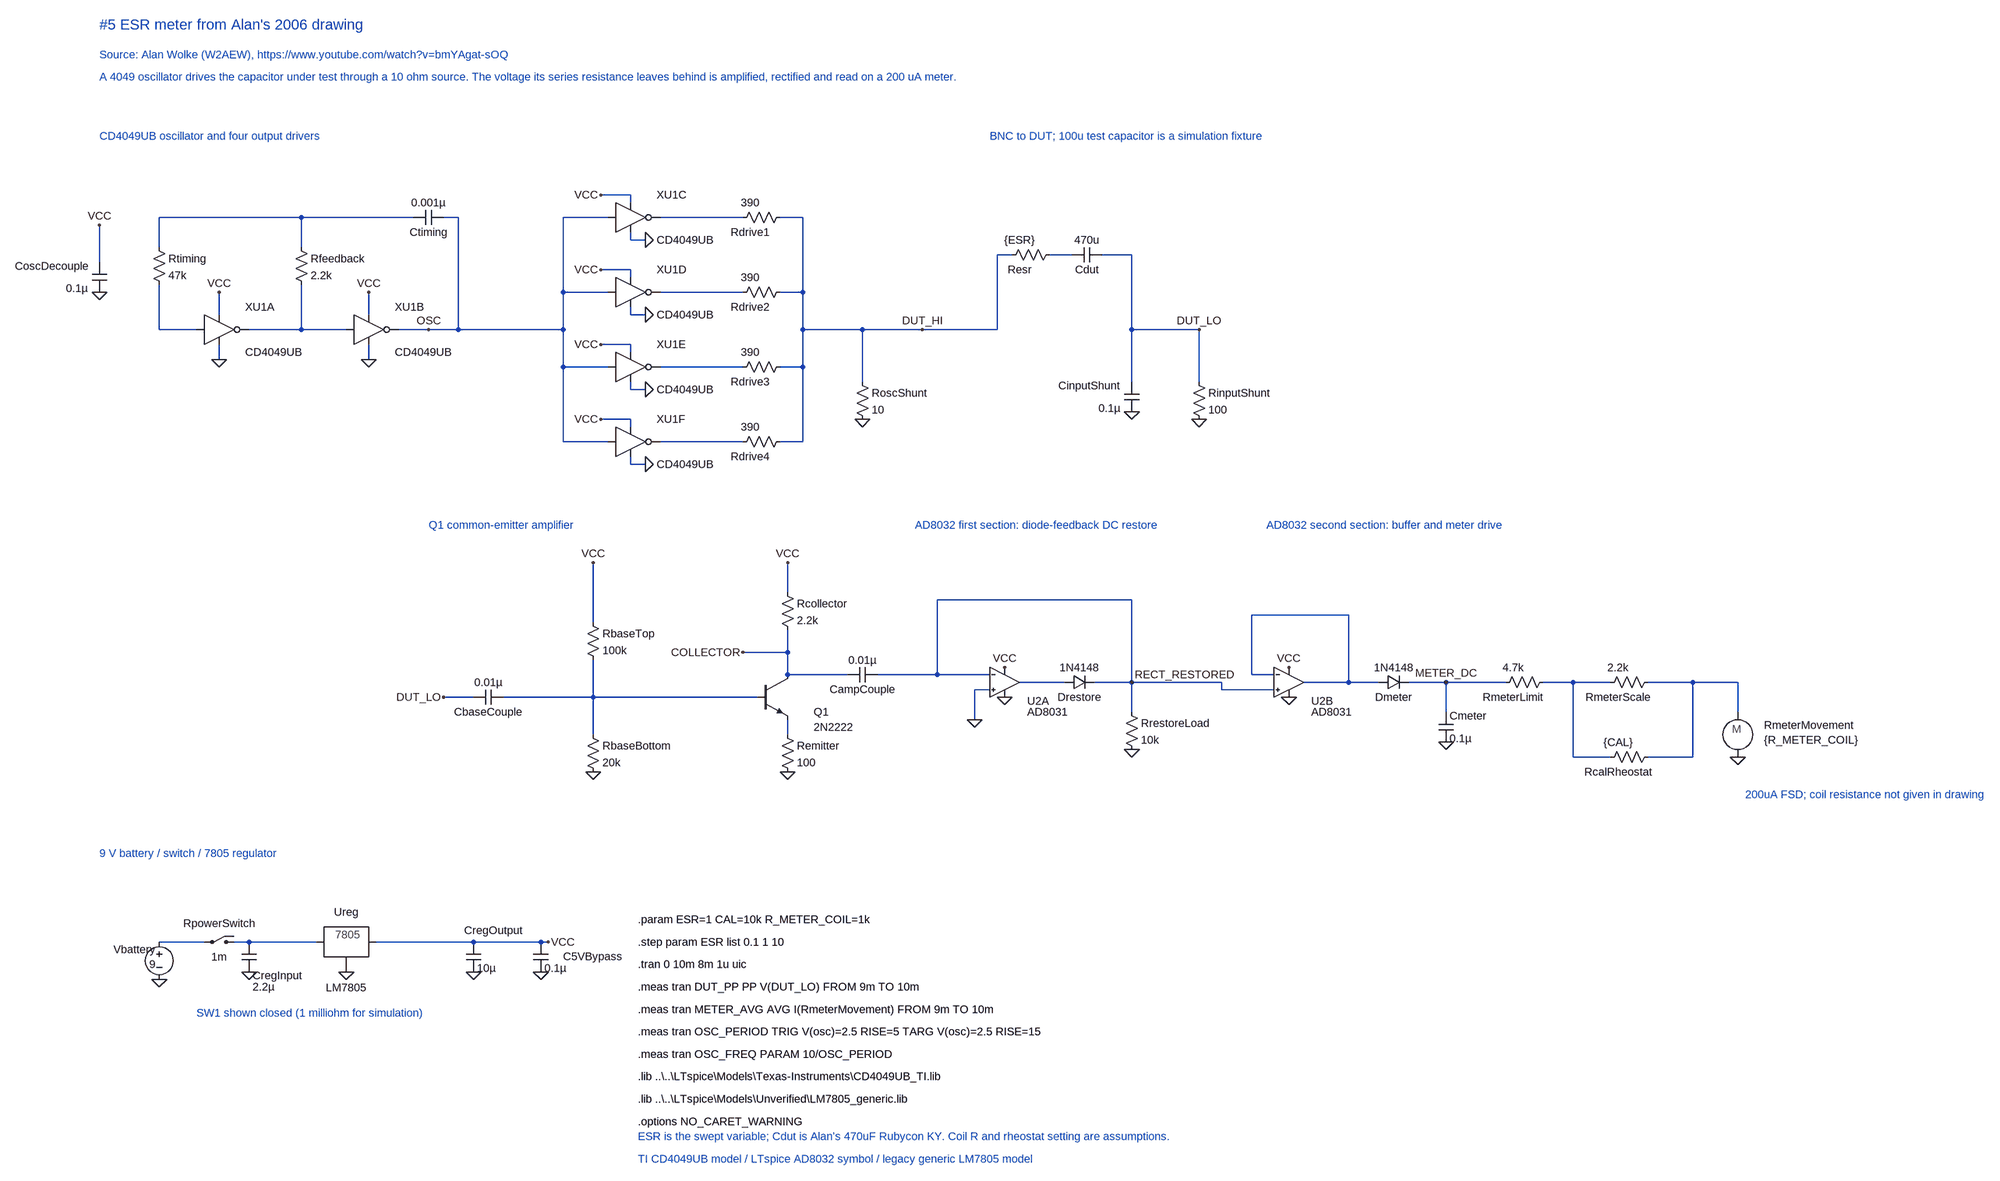
[diagram p0: schematic Alan drawing ESR meter.asc]
Alan drawing ESR meter.asc, the LTspice schematic file:
Version 4.1
SHEET 1 5200 2600
WIRE 336 -672 336 -688
WIRE 336 -688 272 -688
WIRE -368 -640 -672 -640
WIRE -128 -640 -368 -640
WIRE -32 -640 -64 -640
WIRE 288 -640 192 -640
WIRE 576 -640 400 -640
WIRE 704 -640 656 -640
WIRE -672 -576 -672 -640
WIRE -368 -576 -368 -640
WIRE 336 -608 336 -592
WIRE 336 -592 368 -592
WIRE 1152 -560 1120 -560
WIRE 1280 -560 1232 -560
WIRE 1408 -560 1344 -560
WIRE -800 -544 -800 -624
WIRE 336 -512 336 -528
WIRE 336 -528 272 -528
WIRE 192 -480 192 -640
WIRE 288 -480 192 -480
WIRE 576 -480 400 -480
WIRE 704 -480 704 -640
WIRE 704 -480 656 -480
WIRE -544 -432 -544 -480
WIRE -224 -432 -224 -480
WIRE 336 -448 336 -432
WIRE 336 -432 368 -432
WIRE -672 -400 -672 -496
WIRE -592 -400 -672 -400
WIRE -368 -400 -368 -496
WIRE -368 -400 -480 -400
WIRE -272 -400 -368 -400
WIRE -32 -400 -32 -640
WIRE -32 -400 -160 -400
WIRE 192 -400 192 -480
WIRE 192 -400 -32 -400
WIRE 704 -400 704 -480
WIRE 832 -400 704 -400
WIRE 960 -400 832 -400
WIRE 1120 -400 1120 -560
WIRE 1120 -400 960 -400
WIRE 1408 -400 1408 -560
WIRE 1552 -400 1408 -400
WIRE 336 -352 336 -368
WIRE 336 -368 272 -368
WIRE -544 -336 -544 -368
WIRE -224 -336 -224 -368
WIRE 192 -320 192 -400
WIRE 288 -320 192 -320
WIRE 576 -320 400 -320
WIRE 704 -320 704 -400
WIRE 704 -320 656 -320
WIRE 832 -288 832 -400
WIRE 1408 -288 1408 -400
WIRE 1552 -288 1552 -400
WIRE 336 -288 336 -272
WIRE 336 -272 368 -272
WIRE 336 -192 336 -208
WIRE 336 -208 272 -208
WIRE 192 -160 192 -320
WIRE 288 -160 192 -160
WIRE 576 -160 400 -160
WIRE 704 -160 704 -320
WIRE 704 -160 656 -160
WIRE 336 -128 336 -112
WIRE 336 -112 368 -112
WIRE 672 176 672 112
WIRE 1408 192 992 192
WIRE 1872 224 1664 224
WIRE 256 240 256 112
WIRE 672 304 672 256
WIRE 672 304 576 304
WIRE 672 352 672 304
WIRE 800 352 672 352
WIRE 992 352 992 192
WIRE 992 352 864 352
WIRE 1104 352 992 352
WIRE 1664 352 1664 224
WIRE 1712 352 1664 352
WIRE 1264 368 1168 368
WIRE 1408 368 1408 192
WIRE 1408 368 1328 368
WIRE 1600 368 1408 368
WIRE 1872 368 1872 224
WIRE 1872 368 1776 368
WIRE 1936 368 1872 368
WIRE 2080 368 2000 368
WIRE 2208 368 2080 368
WIRE 2352 368 2288 368
WIRE 2432 368 2352 368
WIRE 2608 368 2512 368
WIRE 2704 368 2608 368
WIRE 1104 384 1072 384
WIRE 1600 384 1600 368
WIRE 1712 384 1600 384
WIRE 0 400 -64 400
WIRE 256 400 256 320
WIRE 256 400 64 400
WIRE 608 400 256 400
WIRE 1408 432 1408 368
WIRE 2080 432 2080 368
WIRE 2704 432 2704 368
WIRE 1072 448 1072 384
WIRE 256 480 256 400
WIRE 672 480 672 448
WIRE 2352 528 2352 368
WIRE 2432 528 2352 528
WIRE 2608 528 2608 368
WIRE 2608 528 2512 528
WIRE -576 944 -672 944
WIRE -480 944 -512 944
WIRE -336 944 -480 944
WIRE 0 944 -208 944
WIRE 144 944 0 944
WIRE 160 944 144 944
FLAG -96 -400 OSC
FLAG -544 -480 VCC
FLAG -544 -336 0
FLAG -224 -480 VCC
FLAG -224 -336 0
FLAG -800 -624 VCC
FLAG -800 -480 0
FLAG 272 -688 VCC
FLAG 368 -592 0
FLAG 272 -528 VCC
FLAG 368 -432 0
FLAG 272 -368 VCC
FLAG 368 -272 0
FLAG 272 -208 VCC
FLAG 368 -112 0
FLAG 832 -208 0
FLAG 960 -400 DUT_HI
FLAG 1552 -400 DUT_LO
FLAG 1408 -224 0
FLAG 1552 -208 0
FLAG -64 400 DUT_LO
FLAG 256 112 VCC
FLAG 256 560 0
FLAG 672 112 VCC
FLAG 576 304 COLLECTOR
FLAG 672 560 0
FLAG 1136 336 VCC
FLAG 1136 400 0
FLAG 1072 448 0
FLAG 1408 512 0
FLAG 1408 368 RECT_RESTORED
FLAG 1744 336 VCC
FLAG 1744 400 0
FLAG 2080 496 0
FLAG 2080 368 METER_DC
FLAG 2704 528 0
FLAG -672 1024 0
FLAG -272 1008 0
FLAG -480 1008 0
FLAG 0 1008 0
FLAG 144 1008 0
FLAG 160 944 VCC
SYMBOL ..\..\LTspice\Symbols\CD4049UB_gate -560 -400 R0
SYMATTR InstName XU1A
SYMBOL ..\..\LTspice\Symbols\CD4049UB_gate -240 -400 R0
SYMATTR InstName XU1B
SYMBOL res -688 -592 R0
SYMATTR InstName Rtiming
SYMATTR Value 47k
SYMBOL res -384 -592 R0
SYMATTR InstName Rfeedback
SYMATTR Value 2.2k
SYMBOL cap -128 -624 R270
WINDOW 0 0 32 VBottom 2
WINDOW 3 32 32 VTop 2
SYMATTR InstName Ctiming
SYMATTR Value 0.001µ
SYMBOL cap -816 -544 R0
WINDOW 0 -8 8 Right 2
WINDOW 3 -8 56 Right 2
SYMATTR InstName CoscDecouple
SYMATTR Value 0.1µ
SYMBOL ..\..\LTspice\Symbols\CD4049UB_gate 320 -640 R0
SYMATTR InstName XU1C
SYMBOL res 560 -624 R270
WINDOW 0 0 32 VBottom 2
WINDOW 3 32 32 VTop 2
SYMATTR InstName Rdrive1
SYMATTR Value 390
SYMBOL ..\..\LTspice\Symbols\CD4049UB_gate 320 -480 R0
SYMATTR InstName XU1D
SYMBOL res 560 -464 R270
WINDOW 0 0 32 VBottom 2
WINDOW 3 32 32 VTop 2
SYMATTR InstName Rdrive2
SYMATTR Value 390
SYMBOL ..\..\LTspice\Symbols\CD4049UB_gate 320 -320 R0
SYMATTR InstName XU1E
SYMBOL res 560 -304 R270
WINDOW 0 0 32 VBottom 2
WINDOW 3 32 32 VTop 2
SYMATTR InstName Rdrive3
SYMATTR Value 390
SYMBOL ..\..\LTspice\Symbols\CD4049UB_gate 320 -160 R0
SYMATTR InstName XU1F
SYMBOL res 560 -144 R270
WINDOW 0 0 32 VBottom 2
WINDOW 3 32 32 VTop 2
SYMATTR InstName Rdrive4
SYMATTR Value 390
SYMBOL res 816 -304 R0
SYMATTR InstName RoscShunt
SYMATTR Value 10
SYMBOL res 1136 -544 R270
WINDOW 0 0 32 VBottom 2
WINDOW 3 32 32 VTop 2
SYMATTR InstName Resr
SYMATTR Value {ESR}
SYMBOL cap 1280 -544 R270
WINDOW 0 0 32 VBottom 2
WINDOW 3 32 32 VTop 2
SYMATTR InstName Cdut
SYMATTR Value 470u
SYMBOL cap 1392 -288 R0
WINDOW 0 -8 8 Right 2
WINDOW 3 -8 56 Right 2
SYMATTR InstName CinputShunt
SYMATTR Value 0.1µ
SYMBOL res 1536 -304 R0
SYMATTR InstName RinputShunt
SYMATTR Value 100
SYMBOL cap 0 416 R270
WINDOW 0 0 32 VBottom 2
WINDOW 3 32 32 VTop 2
SYMATTR InstName CbaseCouple
SYMATTR Value 0.01µ
SYMBOL res 240 224 R0
SYMATTR InstName RbaseTop
SYMATTR Value 100k
SYMBOL res 240 464 R0
SYMATTR InstName RbaseBottom
SYMATTR Value 20k
SYMBOL npn 608 352 R0
WINDOW 0 120 80 Left 2
WINDOW 3 120 112 Left 2
SYMATTR InstName Q1
SYMATTR Value 2N2222
SYMBOL res 656 160 R0
SYMATTR InstName Rcollector
SYMATTR Value 2.2k
SYMBOL res 656 464 R0
SYMATTR InstName Remitter
SYMATTR Value 100
SYMBOL cap 800 368 R270
WINDOW 0 0 32 VBottom 2
WINDOW 3 32 32 VTop 2
SYMATTR InstName CampCouple
SYMATTR Value 0.01µ
SYMBOL ..\..\LTspice\Symbols\AD8032-section 1136 368 R0
SYMATTR InstName U2A
SYMBOL diode 1264 384 R270
WINDOW 0 0 32 VBottom 2
WINDOW 3 32 32 VTop 2
SYMATTR InstName Drestore
SYMATTR Value 1N4148
SYMBOL res 1392 416 R0
SYMATTR InstName RrestoreLoad
SYMATTR Value 10k
SYMBOL ..\..\LTspice\Symbols\AD8032-section 1744 368 R0
SYMATTR InstName U2B
SYMBOL diode 1936 384 R270
WINDOW 0 0 32 VBottom 2
WINDOW 3 32 32 VTop 2
SYMATTR InstName Dmeter
SYMATTR Value 1N4148
SYMBOL cap 2064 432 R0
SYMATTR InstName Cmeter
SYMATTR Value 0.1µ
SYMBOL res 2192 384 R270
WINDOW 0 0 32 VBottom 2
WINDOW 3 32 32 VTop 2
SYMATTR InstName RmeterLimit
SYMATTR Value 4.7k
SYMBOL res 2416 384 R270
WINDOW 0 0 32 VBottom 2
WINDOW 3 32 32 VTop 2
SYMATTR InstName RmeterScale
SYMATTR Value 2.2k
SYMBOL res 2416 544 R270
WINDOW 0 0 32 VBottom 2
WINDOW 3 32 32 VTop 2
SYMATTR InstName RcalRheostat
SYMATTR Value {CAL}
SYMBOL ..\..\LTspice\Symbols\meter_movement 2704 464 R0
SYMATTR InstName RmeterMovement
SYMBOL voltage -672 928 R0
WINDOW 0 -8 32 Right 2
WINDOW 3 -8 64 Right 2
SYMATTR InstName Vbattery
SYMATTR Value 9
SYMBOL ..\..\LTspice\Symbols\power_switch_closed -544 944 R0
WINDOW 0 0 -40 Center 2
SYMATTR InstName RpowerSwitch
SYMBOL ..\..\LTspice\Symbols\LM7805 -272 944 R0
WINDOW 3 0 98 Center 2
SYMATTR InstName Ureg
SYMBOL cap -496 944 R0
WINDOW 0 24 72 Left 2
WINDOW 3 24 96 Left 2
SYMATTR InstName CregInput
SYMATTR Value 2.2µ
SYMBOL cap -16 944 R0
WINDOW 0 -4 -25 Left 2
SYMATTR InstName CregOutput
SYMATTR Value 10µ
SYMBOL cap 128 944 R0
WINDOW 0 64 31 Left 2
SYMATTR InstName C5VBypass
SYMATTR Value 0.1µ
TEXT -800 -1056 Left 3 ;#5 ESR meter from Alan's 2006 drawing
TEXT -800 -992 Left 2 ;Source: Alan Wolke (W2AEW), https://www.youtube.com/watch?v=bmYAgat-sOQ
TEXT -800 -944 Left 2 ;A 4049 oscillator drives the capacitor under test through a 10 ohm source. The voltage its series resistance leaves behind is amplified, rectified and read on a 200 uA meter.
TEXT -800 -816 Left 2 ;CD4049UB oscillator and four output drivers
TEXT 1104 -816 Left 2 ;BNC to DUT; 100u test capacitor is a simulation fixture
TEXT -96 32 Left 2 ;Q1 common-emitter amplifier
TEXT 944 32 Left 2 ;AD8032 first section: diode-feedback DC restore
TEXT 1696 32 Left 2 ;AD8032 second section: buffer and meter drive
TEXT 2720 608 Left 2 ;200uA FSD; coil resistance not given in drawing
TEXT -800 736 Left 2 ;9 V battery / switch / 7805 regulator
TEXT -592 1096 Left 2 ;SW1 shown closed (1 milliohm for simulation)
TEXT 352 896 Left 2 !.param ESR=1 CAL=10k R_METER_COIL=1k
TEXT 352 944 Left 2 !.step param ESR list 0.1 1 10
TEXT 352 992 Left 2 !.tran 0 10m 8m 1u uic
TEXT 352 1040 Left 2 !.meas tran DUT_PP PP V(DUT_LO) FROM 9m TO 10m
TEXT 352 1136 Left 2 !.meas tran OSC_PERIOD TRIG V(osc)=2.5 RISE=5 TARG V(osc)=2.5 RISE=15
TEXT 352 1184 Left 2 !.meas tran OSC_FREQ PARAM 10/OSC_PERIOD
TEXT 352 1088 Left 2 !.meas tran METER_AVG AVG I(RmeterMovement) FROM 9m TO 10m
TEXT 352 1232 Left 2 !.lib ..\..\LTspice\Models\Texas-Instruments\CD4049UB_TI.lib
TEXT 352 1280 Left 2 !.lib ..\..\LTspice\Models\Unverified\LM7805_generic.lib
TEXT 352 1328 Left 2 !.options NO_CARET_WARNING
TEXT 352 1360 Left 2 ;ESR is the swept variable; Cdut is Alan's 470uF Rubycon KY. Coil R and rheostat setting are assumptions.
TEXT 352 1408 Left 2 ;TI CD4049UB model / LTspice AD8032 symbol / legacy generic LM7805 model

The netlist it stands for:
* Alan drawing ESR meter.asc
X§XU1A N006 N005 VCC 0 CD4049UB  ; pins OUT IN VCC GND
X§XU1B OSC N006 VCC 0 CD4049UB  ; pins OUT IN VCC GND
Rtiming N001 N005 47k
Rfeedback N001 N006 2.2k
Ctiming N001 OSC 0.001µ
CoscDecouple VCC 0 0.1µ
X§XU1C N002 OSC VCC 0 CD4049UB  ; pins OUT IN VCC GND
Rdrive1 N002 DUT_HI 390
X§XU1D N004 OSC VCC 0 CD4049UB  ; pins OUT IN VCC GND
Rdrive2 N004 DUT_HI 390
X§XU1E N007 OSC VCC 0 CD4049UB  ; pins OUT IN VCC GND
Rdrive3 N007 DUT_HI 390
X§XU1F N008 OSC VCC 0 CD4049UB  ; pins OUT IN VCC GND
Rdrive4 N008 DUT_HI 390
RoscShunt DUT_HI 0 10
Resr DUT_HI N003 {ESR}
Cdut N003 DUT_LO 470u
CinputShunt DUT_LO 0 0.1µ
RinputShunt DUT_LO 0 100
CbaseCouple DUT_LO N013 0.01µ
RbaseTop VCC N013 100k
RbaseBottom N013 0 20k
Q1 COLLECTOR N013 N014 0 2N2222
Rcollector VCC COLLECTOR 2.2k
Remitter N014 0 100
CampCouple COLLECTOR RECT_RESTORED 0.01µ
X§U2A 0 RECT_RESTORED VCC 0 N010 AD8031  ; pins IN+ IN- VCC VEE OUT
Drestore N010 RECT_RESTORED 1N4148
RrestoreLoad RECT_RESTORED 0 10k
X§U2B RECT_RESTORED N009 VCC 0 N009 AD8031  ; pins IN+ IN- VCC VEE OUT
Dmeter N009 METER_DC 1N4148
Cmeter METER_DC 0 0.1µ
RmeterLimit METER_DC N011 4.7k
RmeterScale N011 N012 2.2k
RcalRheostat N011 N012 {CAL}
RmeterMovement N012 0 {R_METER_COIL}
Vbattery N015 0 9
RpowerSwitch N015 N016 1m
X§Ureg N016 0 VCC LM7805  ; pins IN GND OUT
CregInput N016 0 2.2µ
CregOutput VCC 0 10µ
C5VBypass VCC 0 0.1µ
.model D D
.lib standard.dio
.model NPN NPN
.model PNP PNP
.lib standard.bjt
* #5 ESR meter from Alan's 2006 drawing
* Source: Alan Wolke (W2AEW), https://www.youtube.com/watch?v=bmYAgat-sOQ
* A 4049 oscillator drives the capacitor under test through a 10 ohm source. The voltage its series resistance leaves behind is amplified, rectified and read on a 200 uA meter.
* CD4049UB oscillator and four output drivers
* BNC to DUT; 100u test capacitor is a simulation fixture
* Q1 common-emitter amplifier
* AD8032 first section: diode-feedback DC restore
* AD8032 second section: buffer and meter drive
* 200uA FSD; coil resistance not given in drawing
* 9 V battery / switch / 7805 regulator
* SW1 shown closed (1 milliohm for simulation)
.param ESR=1 CAL=10k R_METER_COIL=1k
.step param ESR list 0.1 1 10
.tran 0 10m 8m 1u uic
.meas tran DUT_PP PP V(DUT_LO) FROM 9m TO 10m
.meas tran OSC_PERIOD TRIG V(osc)=2.5 RISE=5 TARG V(osc)=2.5 RISE=15
.meas tran OSC_FREQ PARAM 10/OSC_PERIOD
.meas tran METER_AVG AVG I(RmeterMovement) FROM 9m TO 10m
.lib ..\..\LTspice\Models\Texas-Instruments\CD4049UB_TI.lib
.lib ..\..\LTspice\Models\Unverified\LM7805_generic.lib
.options NO_CARET_WARNING
* ESR is the swept variable; Cdut is Alan's 470uF Rubycon KY. Coil R and rheostat setting are assumptions.
* TI CD4049UB model / LTspice AD8032 symbol / legacy generic LM7805 model
.lib ADI.lib
.backanno
.end